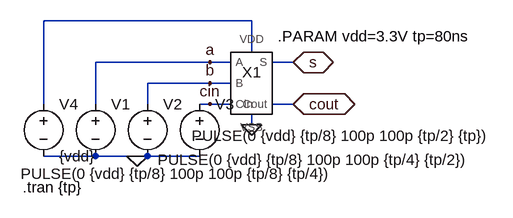
[diagram p0: schematic full_adder_tb.asc]
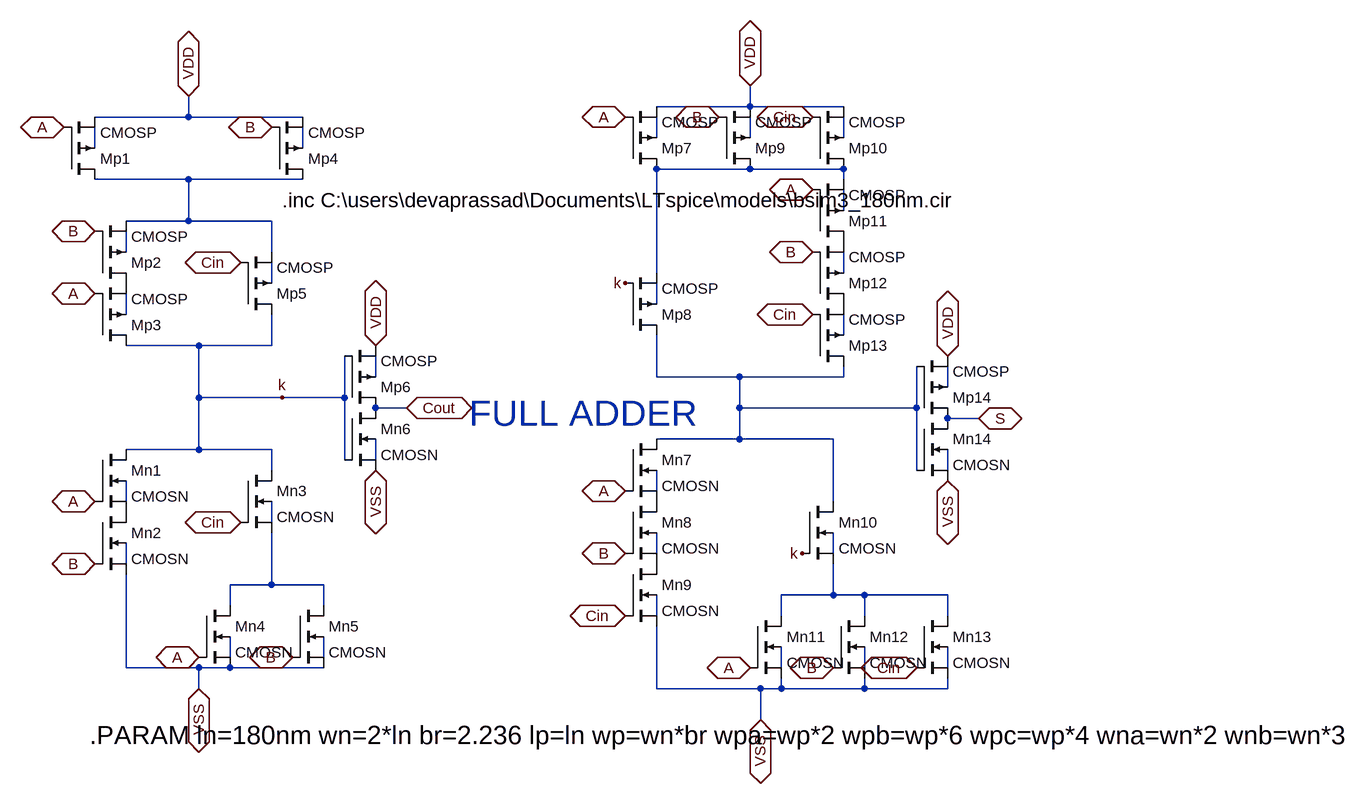
[diagram p1: sub-circuit full_adder.asc]
full_adder_tb.asc, the LTspice schematic file:
Version 4.1
SHEET 1 880 680
WIRE 208 48 -112 48
WIRE 208 96 208 48
WIRE 144 112 -32 112
WIRE 176 112 144 112
WIRE 272 112 240 112
WIRE 144 144 48 144
WIRE 176 144 144 144
WIRE -112 176 -112 48
WIRE -32 176 -32 112
WIRE 48 176 48 144
WIRE 144 176 128 176
WIRE 176 176 144 176
WIRE 272 176 240 176
WIRE 208 208 208 192
WIRE -32 256 -112 256
WIRE 32 256 -32 256
WIRE 48 256 32 256
WIRE 128 256 48 256
FLAG 32 256 0
FLAG 272 112 s
IOPIN 272 112 BiDir
FLAG 272 176 cout
IOPIN 272 176 BiDir
FLAG 144 112 a
FLAG 144 144 b
FLAG 144 176 cin
FLAG 208 208 0
SYMBOL diglib\\full\ adder\\full_adder 208 144 R0
WINDOW 0 0 -1 Bottom 2
SYMATTR InstName X1
SYMBOL voltage -32 160 R0
WINDOW 3 -115 123 Left 2
WINDOW 123 0 0 Left 0
WINDOW 39 0 0 Left 0
SYMATTR Value PULSE(0 {vdd} {tp/8} 100p 100p {tp/8} {tp/4})
SYMATTR InstName V1
SYMBOL voltage 48 160 R0
WINDOW 3 16 102 Left 2
WINDOW 123 0 0 Left 0
WINDOW 39 0 0 Left 0
SYMATTR Value PULSE(0 {vdd} {tp/8} 100p 100p {tp/4} {tp/2})
SYMATTR InstName V2
SYMBOL voltage 128 160 R0
WINDOW 3 -12 65 Left 2
WINDOW 123 0 0 Left 0
WINDOW 39 0 0 Left 0
SYMATTR Value PULSE(0 {vdd} {tp/8} 100p 100p {tp/2} {tp})
SYMATTR InstName V3
SYMBOL voltage -112 160 R0
WINDOW 123 0 0 Left 0
WINDOW 39 0 0 Left 0
SYMATTR InstName V4
SYMATTR Value {vdd}
TEXT 248 72 Left 2 !.PARAM vdd=3.3V tp=80ns
TEXT -144 304 Left 2 !.tran {tp}

full_adder.asc, the sub-circuit schematic file:
Version 4.1
SHEET 1 1960 1248
WIRE 1136 64 1136 32
WIRE 1136 64 992 64
WIRE 1280 64 1136 64
WIRE 272 80 272 48
WIRE 272 80 128 80
WIRE 448 80 272 80
WIRE 992 112 992 80
WIRE 1136 112 1136 80
WIRE 1280 112 1280 80
WIRE 128 128 128 96
WIRE 448 128 448 96
WIRE 1136 160 992 160
WIRE 1280 160 1136 160
WIRE 272 176 128 176
WIRE 448 176 272 176
WIRE 1280 176 1280 160
WIRE 1280 224 1280 192
WIRE 272 240 272 176
WIRE 272 240 176 240
WIRE 400 240 272 240
WIRE 176 288 176 256
WIRE 400 288 400 240
WIRE 992 320 992 160
WIRE 1280 320 1280 288
WIRE 400 336 400 304
WIRE 992 368 992 336
WIRE 176 384 176 352
WIRE 1280 416 1280 384
WIRE 288 432 176 432
WIRE 400 432 400 384
WIRE 400 432 288 432
WIRE 560 480 560 448
WIRE 992 480 992 416
WIRE 1120 480 992 480
WIRE 1280 480 1280 464
WIRE 1280 480 1120 480
WIRE 1440 496 1440 464
WIRE 288 512 288 432
WIRE 416 512 288 512
WIRE 512 512 512 448
WIRE 512 512 416 512
WIRE 608 528 560 528
WIRE 1120 528 1120 480
WIRE 1392 528 1392 464
WIRE 1392 528 1120 528
WIRE 1488 544 1440 544
WIRE 1120 576 1120 528
WIRE 1120 576 992 576
WIRE 1264 576 1120 576
WIRE 288 592 288 512
WIRE 288 592 176 592
WIRE 400 592 288 592
WIRE 512 608 512 512
WIRE 560 608 560 576
WIRE 400 624 400 592
WIRE 1392 624 1392 528
WIRE 1440 624 1440 592
WIRE 992 656 992 624
WIRE 176 672 176 640
WIRE 1264 672 1264 576
WIRE 400 704 400 672
WIRE 992 752 992 720
WIRE 1264 752 1264 720
WIRE 176 768 176 736
WIRE 400 800 400 720
WIRE 400 800 336 800
WIRE 480 800 400 800
WIRE 1264 816 1264 768
WIRE 1264 816 1184 816
WIRE 1312 816 1264 816
WIRE 1440 816 1312 816
WIRE 336 832 336 800
WIRE 480 832 480 800
WIRE 992 848 992 816
WIRE 1184 848 1184 816
WIRE 1312 848 1312 816
WIRE 1440 848 1440 816
WIRE 336 912 336 880
WIRE 480 912 480 880
WIRE 176 928 176 784
WIRE 288 928 176 928
WIRE 336 928 288 928
WIRE 480 928 336 928
WIRE 1184 928 1184 896
WIRE 1312 928 1312 896
WIRE 1440 928 1440 896
WIRE 288 960 288 928
WIRE 992 960 992 864
WIRE 1152 960 992 960
WIRE 1184 960 1184 944
WIRE 1184 960 1152 960
WIRE 1312 960 1312 944
WIRE 1312 960 1184 960
WIRE 1440 960 1440 944
WIRE 1440 960 1312 960
WIRE 1152 1008 1152 960
FLAG 1136 32 VDD
IOPIN 1136 32 BiDir
FLAG 1440 448 VDD
IOPIN 1440 448 BiDir
FLAG 1440 640 VSS
IOPIN 1440 640 BiDir
FLAG 1152 1008 VSS
IOPIN 1152 1008 BiDir
FLAG 272 48 VDD
IOPIN 272 48 BiDir
FLAG 560 432 VDD
IOPIN 560 432 BiDir
FLAG 560 624 VSS
IOPIN 560 624 BiDir
FLAG 288 960 VSS
IOPIN 288 960 BiDir
FLAG 80 96 A
IOPIN 80 96 BiDir
FLAG 400 96 B
IOPIN 400 96 BiDir
FLAG 128 256 B
IOPIN 128 256 BiDir
FLAG 128 352 A
IOPIN 128 352 BiDir
FLAG 352 304 Cin
IOPIN 352 304 BiDir
FLAG 128 672 A
IOPIN 128 672 BiDir
FLAG 128 768 B
IOPIN 128 768 BiDir
FLAG 352 704 Cin
IOPIN 352 704 BiDir
FLAG 944 80 A
IOPIN 944 80 BiDir
FLAG 1088 80 B
IOPIN 1088 80 BiDir
FLAG 1232 80 Cin
IOPIN 1232 80 BiDir
FLAG 944 336 k
FLAG 1232 192 A
IOPIN 1232 192 BiDir
FLAG 1232 288 B
IOPIN 1232 288 BiDir
FLAG 1232 384 Cin
IOPIN 1232 384 BiDir
FLAG 432 912 B
IOPIN 432 912 BiDir
FLAG 288 912 A
IOPIN 288 912 BiDir
FLAG 1488 544 S
IOPIN 1488 544 BiDir
FLAG 608 528 Cout
IOPIN 608 528 BiDir
FLAG 944 656 A
IOPIN 944 656 BiDir
FLAG 944 752 B
IOPIN 944 752 BiDir
FLAG 944 848 Cin
IOPIN 944 848 BiDir
FLAG 1216 752 k
FLAG 1136 928 A
IOPIN 1136 928 BiDir
FLAG 1264 928 B
IOPIN 1264 928 BiDir
FLAG 1392 928 Cin
IOPIN 1392 928 BiDir
FLAG 416 512 k
SYMBOL nmos4 944 576 R0
SYMATTR InstName Mn7
SYMATTR Value CMOSN
SYMATTR Value2 l={ln} w={wnb} ad={ln*wnb} as={ln*wnb} pd={2*ln+wnb} ps={2*ln+wnb}
SYMBOL nmos4 1216 672 R0
SYMATTR InstName Mn10
SYMATTR Value CMOSN
SYMATTR Value2 l={ln} w={wna} ad={ln*wna} as={ln*wna} pd={2*ln+wna} ps={2*ln+wna}
SYMBOL nmos4 1392 544 R0
SYMATTR InstName Mn14
SYMATTR Value CMOSN
SYMATTR Value2 l={ln} w={wn} ad={ln*wn} as={ln*wn} pd={2*ln+wn} ps={2*ln+wn}
SYMBOL pmos4 80 176 M180
SYMATTR InstName Mp1
SYMATTR Value CMOSP
SYMATTR Value2 l={lp} w={wpa} ad={lp*wpa} as={lp*wpa} pd={2*lp+wpa} ps={2*lp+wpa}
SYMBOL nmos4 128 592 R0
SYMATTR InstName Mn1
SYMATTR Value CMOSN
SYMATTR Value2 l={ln} w={wna} ad={ln*wna} as={ln*wna} pd={2*ln+wna} ps={2*ln+wna}
SYMBOL nmos4 512 528 R0
SYMATTR InstName Mn6
SYMATTR Value CMOSN
SYMATTR Value2 l={ln} w={wn} ad={ln*wn} as={ln*wn} pd={2*ln+wn} ps={2*ln+wn}
SYMBOL nmos4 1136 848 R0
SYMATTR InstName Mn11
SYMATTR Value CMOSN
SYMATTR Value2 l={ln} w={wna} ad={ln*wna} as={ln*wna} pd={2*ln+wna} ps={2*ln+wna}
SYMBOL nmos4 1264 848 R0
SYMATTR InstName Mn12
SYMATTR Value CMOSN
SYMATTR Value2 l={ln} w={wna} ad={ln*wna} as={ln*wna} pd={2*ln+wna} ps={2*ln+wna}
SYMBOL nmos4 1392 848 R0
SYMATTR InstName Mn13
SYMATTR Value CMOSN
SYMATTR Value2 l={ln} w={wna} ad={ln*wna} as={ln*wna} pd={2*ln+wna} ps={2*ln+wna}
SYMBOL nmos4 944 672 R0
SYMATTR InstName Mn8
SYMATTR Value CMOSN
SYMATTR Value2 l={ln} w={wnb} ad={ln*wnb} as={ln*wnb} pd={2*ln+wnb} ps={2*ln+wnb}
SYMBOL nmos4 944 768 R0
SYMATTR InstName Mn9
SYMATTR Value CMOSN
SYMATTR Value2 l={ln} w={wnb} ad={ln*wnb} as={ln*wnb} pd={2*ln+wnb} ps={2*ln+wnb}
SYMBOL pmos4 128 336 M180
SYMATTR InstName Mp2
SYMATTR Value CMOSP
SYMATTR Value2 l={lp} w={wpc} ad={lp*wpc} as={lp*wpc} pd={2*lp+wpc} ps={2*lp+wpc}
SYMBOL pmos4 512 528 M180
SYMATTR InstName Mp6
SYMATTR Value CMOSP
SYMATTR Value2 l={lp} w={wp} ad={lp*wp} as={lp*wp} pd={2*lp+wp} ps={2*lp+wp}
SYMBOL pmos4 944 160 M180
SYMATTR InstName Mp7
SYMATTR Value CMOSP
SYMATTR Value2 l={lp} w={wpa} ad={lp*wpa} as={lp*wpa} pd={2*lp+wpa} ps={2*lp+wpa}
SYMBOL pmos4 1232 272 M180
SYMATTR InstName Mp11
SYMATTR Value CMOSP
SYMATTR Value2 l={lp} w={wpb} ad={lp*wpb} as={lp*wpb} pd={2*lp+wpb} ps={2*lp+wpb}
SYMBOL pmos4 1232 368 M180
SYMATTR InstName Mp12
SYMATTR Value CMOSP
SYMATTR Value2 l={lp} w={wpb} ad={lp*wpb} as={lp*wpb} pd={2*lp+wpb} ps={2*lp+wpb}
SYMBOL pmos4 1232 464 M180
SYMATTR InstName Mp13
SYMATTR Value CMOSP
SYMATTR Value2 l={lp} w={wpb} ad={lp*wpb} as={lp*wpb} pd={2*lp+wpb} ps={2*lp+wpb}
SYMBOL pmos4 1392 544 M180
SYMATTR InstName Mp14
SYMATTR Value CMOSP
SYMATTR Value2 l={lp} w={wp} ad={lp*wp} as={lp*wp} pd={2*lp+wp} ps={2*lp+wp}
SYMBOL pmos4 400 176 M180
SYMATTR InstName Mp4
SYMATTR Value CMOSP
SYMATTR Value2 l={lp} w={wpa} ad={lp*wpa} as={lp*wpa} pd={2*lp+wpa} ps={2*lp+wpa}
SYMBOL pmos4 352 384 M180
SYMATTR InstName Mp5
SYMATTR Value CMOSP
SYMATTR Value2 l={lp} w={wpa} ad={lp*wpa} as={lp*wpa} pd={2*lp+wpa} ps={2*lp+wpa}
SYMBOL pmos4 128 432 M180
SYMATTR InstName Mp3
SYMATTR Value CMOSP
SYMATTR Value2 l={lp} w={wpc} ad={lp*wpc} as={lp*wpc} pd={2*lp+wpc} ps={2*lp+wpc}
SYMBOL pmos4 1088 160 M180
SYMATTR InstName Mp9
SYMATTR Value CMOSP
SYMATTR Value2 l={lp} w={wpa} ad={lp*wpa} as={lp*wpa} pd={2*lp+wpa} ps={2*lp+wpa}
SYMBOL pmos4 1232 160 M180
SYMATTR InstName Mp10
SYMATTR Value CMOSP
SYMATTR Value2 l={lp} w={wpa} ad={lp*wpa} as={lp*wpa} pd={2*lp+wpa} ps={2*lp+wpa}
SYMBOL pmos4 944 416 M180
SYMATTR InstName Mp8
SYMATTR Value CMOSP
SYMATTR Value2 l={lp} w={wpa} ad={lp*wpa} as={lp*wpa} pd={2*lp+wpa} ps={2*lp+wpa}
SYMBOL nmos4 128 688 R0
SYMATTR InstName Mn2
SYMATTR Value CMOSN
SYMATTR Value2 l={ln} w={wna} ad={ln*wna} as={ln*wna} pd={2*ln+wna} ps={2*ln+wna}
SYMBOL nmos4 352 624 R0
SYMATTR InstName Mn3
SYMATTR Value CMOSN
SYMATTR Value2 l={ln} w={wna} ad={ln*wna} as={ln*wna} pd={2*ln+wna} ps={2*ln+wna}
SYMBOL nmos4 288 832 R0
SYMATTR InstName Mn4
SYMATTR Value CMOSN
SYMATTR Value2 l={ln} w={wna} ad={ln*wna} as={ln*wna} pd={2*ln+wna} ps={2*ln+wna}
SYMBOL nmos4 432 832 R0
SYMATTR InstName Mn5
SYMATTR Value CMOSN
SYMATTR Value2 l={ln} w={wna} ad={ln*wna} as={ln*wna} pd={2*ln+wna} ps={2*ln+wna}
TEXT 416 208 Left 3 !.inc C:\\users\\devaprassad\\Documents\\LTspice\\models\\bsim3_180nm.cir
TEXT 120 1032 Left 4 !.PARAM ln=180nm wn=2*ln br=2.236 lp=ln wp=wn*br wpa=wp*2 wpb=wp*6 wpc=wp*4 wna=wn*2 wnb=wn*3
TEXT 704 536 Left 5 ;FULL ADDER

The netlist it stands for:
* full_adder_tb.asc
X§X1 a b cin cout s N001 0 full_adder
V1 a 0 PULSE(0 {vdd} {tp/8} 100p 100p {tp/8} {tp/4})
V2 b 0 PULSE(0 {vdd} {tp/8} 100p 100p {tp/4} {tp/2})
V3 cin 0 PULSE(0 {vdd} {tp/8} 100p 100p {tp/2} {tp})
V4 N001 0 {vdd}

* block symbol definitions
.subckt full_adder A B Cin Cout S VDD VSS
Mn7 N016 A P001 N020 CMOSN l={ln} w={wnb} ad={ln*wnb} as={ln*wnb} pd={2*ln+wnb} ps={2*ln+wnb}
Mn10 N016 k N027 N024 CMOSN l={ln} w={wna} ad={ln*wna} as={ln*wna} pd={2*ln+wna} ps={2*ln+wna}
Mn14 S N016 VSS N019 CMOSN l={ln} w={wn} ad={ln*wn} as={ln*wn} pd={2*ln+wn} ps={2*ln+wn}
Mp1 N007 A VDD N004 CMOSP l={lp} w={wpa} ad={lp*wpa} as={lp*wpa} pd={2*lp+wpa} ps={2*lp+wpa}
Mn1 k A P002 N021 CMOSN l={ln} w={wna} ad={ln*wna} as={ln*wna} pd={2*ln+wna} ps={2*ln+wna}
Mn6 Cout k VSS N018 CMOSN l={ln} w={wn} ad={ln*wn} as={ln*wn} pd={2*ln+wn} ps={2*ln+wn}
Mn11 N027 A VSS N031 CMOSN l={ln} w={wna} ad={ln*wna} as={ln*wna} pd={2*ln+wna} ps={2*ln+wna}
Mn12 N027 B VSS N032 CMOSN l={ln} w={wna} ad={ln*wna} as={ln*wna} pd={2*ln+wna} ps={2*ln+wna}
Mn13 N027 Cin VSS N033 CMOSN l={ln} w={wna} ad={ln*wna} as={ln*wna} pd={2*ln+wna} ps={2*ln+wna}
Mn8 P001 B P003 N023 CMOSN l={ln} w={wnb} ad={ln*wnb} as={ln*wnb} pd={2*ln+wnb} ps={2*ln+wnb}
Mn9 P003 Cin VSS N028 CMOSN l={ln} w={wnb} ad={ln*wnb} as={ln*wnb} pd={2*ln+wnb} ps={2*ln+wnb}
Mp2 P004 B N007 N009 CMOSP l={lp} w={wpc} ad={lp*wpc} as={lp*wpc} pd={2*lp+wpc} ps={2*lp+wpc}
Mp6 Cout k VDD N015 CMOSP l={lp} w={wp} ad={lp*wp} as={lp*wp} pd={2*lp+wp} ps={2*lp+wp}
Mp7 N006 A VDD N001 CMOSP l={lp} w={wpa} ad={lp*wpa} as={lp*wpa} pd={2*lp+wpa} ps={2*lp+wpa}
Mp11 P005 A N006 N008 CMOSP l={lp} w={wpb} ad={lp*wpb} as={lp*wpb} pd={2*lp+wpb} ps={2*lp+wpb}
Mp12 P006 B P005 N010 CMOSP l={lp} w={wpb} ad={lp*wpb} as={lp*wpb} pd={2*lp+wpb} ps={2*lp+wpb}
Mp13 N016 Cin P006 N014 CMOSP l={lp} w={wpb} ad={lp*wpb} as={lp*wpb} pd={2*lp+wpb} ps={2*lp+wpb}
Mp14 S N016 VDD N017 CMOSP l={lp} w={wp} ad={lp*wp} as={lp*wp} pd={2*lp+wp} ps={2*lp+wp}
Mp4 N007 B VDD N005 CMOSP l={lp} w={wpa} ad={lp*wpa} as={lp*wpa} pd={2*lp+wpa} ps={2*lp+wpa}
Mp5 k Cin N007 N011 CMOSP l={lp} w={wpa} ad={lp*wpa} as={lp*wpa} pd={2*lp+wpa} ps={2*lp+wpa}
Mp3 k A P004 N013 CMOSP l={lp} w={wpc} ad={lp*wpc} as={lp*wpc} pd={2*lp+wpc} ps={2*lp+wpc}
Mp9 N006 B VDD N002 CMOSP l={lp} w={wpa} ad={lp*wpa} as={lp*wpa} pd={2*lp+wpa} ps={2*lp+wpa}
Mp10 N006 Cin VDD N003 CMOSP l={lp} w={wpa} ad={lp*wpa} as={lp*wpa} pd={2*lp+wpa} ps={2*lp+wpa}
Mp8 N016 k N006 N012 CMOSP l={lp} w={wpa} ad={lp*wpa} as={lp*wpa} pd={2*lp+wpa} ps={2*lp+wpa}
Mn2 P002 B VSS N025 CMOSN l={ln} w={wna} ad={ln*wna} as={ln*wna} pd={2*ln+wna} ps={2*ln+wna}
Mn3 k Cin N026 N022 CMOSN l={ln} w={wna} ad={ln*wna} as={ln*wna} pd={2*ln+wna} ps={2*ln+wna}
Mn4 N026 A VSS N029 CMOSN l={ln} w={wna} ad={ln*wna} as={ln*wna} pd={2*ln+wna} ps={2*ln+wna}
Mn5 N026 B VSS N030 CMOSN l={ln} w={wna} ad={ln*wna} as={ln*wna} pd={2*ln+wna} ps={2*ln+wna}
.inc C:\users\devaprassad\Documents\LTspice\models\bsim3_180nm.cir
.PARAM ln=180nm wn=2*ln br=2.236 lp=ln wp=wn*br wpa=wp*2 wpb=wp*6 wpc=wp*4 wna=wn*2 wnb=wn*3
* FULL ADDER
.ends full_adder

.model NMOS NMOS
.model PMOS PMOS
.lib standard.mos
.PARAM vdd=3.3V tp=80ns
.tran {tp}
.backanno
.end